# Altium schematic sheet LightSense.SchDoc
size A4; SheetNumber: 2; SheetTotal: 2
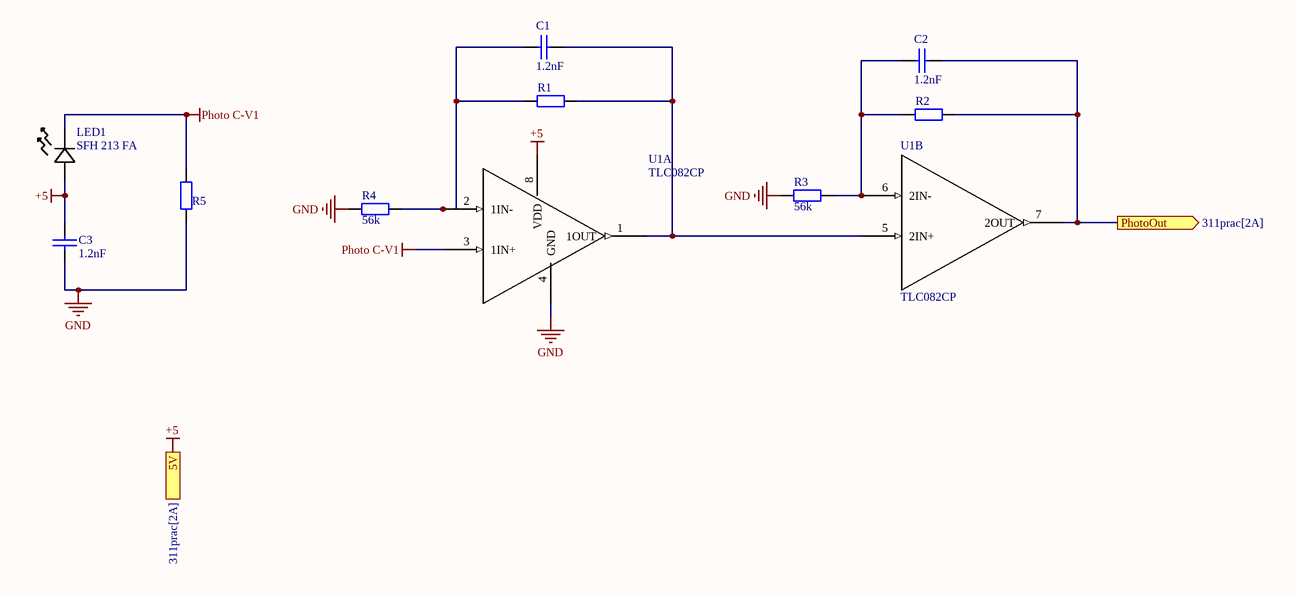
[diagram p0: LightSense.SchDoc]

## Parts
C1  value 1.2nF  [ECE-CAPR0.2x0.1TH]  (hidden comment: CAP000026)
C2  value 1.2nF  [ECE-CAPR0.2x0.1TH]  (hidden comment: CAP000026)
C3  value 1.2nF  [ECE-CAPR0.2x0.1TH]  (hidden comment: CAP000026)
LED1  SFH 213 FA  [LED_SFH 213 FA_OSR]
R1  RES000058  [ECE-RESA0.4TH]  (value not drawn)
R2  RES000058  [ECE-RESA0.4TH]  (value not drawn)
R3  value 56k  [ECE-RESA0.4TH]
R4  value 56k  [ECE-RESA0.4TH]  (hidden comment: RES000058)
R5  RES000058  [ECE-RESA0.4TH]  (value not drawn)
U1  TLC082CP  [TLC082_TH]  (parts A,B of 2)

## Ports
5V (in, see 311prac[2A]), PhotoOut (out, see 311prac[2A])

## Nets
+5: C3.2 LED1.2 U1.8(VDD) ; port 5V
GND: C3.1 R3.1 R4.1 R5.1 U1.4(GND)
Photo C-V1: LED1.1 R5.2 U1.3(1IN+)
PhotoOut: C2.2 R2.2 U1.7(2OUT) ; port PhotoOut
NetC1_1: C1.1 R1.1 R4.2 U1.2(1IN-)
NetC1_2: C1.2 R1.2 U1.1(1OUT) U1.5(2IN+)
NetC2_1: C2.1 R2.1 R3.2 U1.6(2IN-)

## Library data of the parts
C1-C3 = CMP-039-000025-1: CAP CER 1.2nF 50V TH; Path: ece/ts/Lists/Stock Inventory; Assembly Method: Through hole; Item Type: Item; Status: Obsolete; Component Type: NA; UoA Stock#: CAP000026; Datasheet Link: http://share.engineering.auckland.ac.nz/ece/ts/Student%20Documents/CER%20CAP.pdf; Size/Package: Radial; Voltage/Current: 50V; Category: Capacitor
LED1 = SFH 213 FA: Description; Manufacturer_Name: ams OSRAM; Copyright: Copyright (C) 2026 Ultra Librarian. All rights reserved.; Manufacturer_Part_Number: SFH 213 FA
R1 R2 R4 R5 = CMP-052-000057-1: RES MF 56K TH; Path: ece/ts/Lists/Stock Inventory; Voltage/Current: 0.6W; Item Type: Item; Assembly Method: Through hole; Component Type: NA; Size/Package: Axial 10mm; Supplier1: Active components; UoA Stock#: RES000058; Supplier1-PN: T442124; Category: Resistor; Status: Active
  R1 R2 R5: Value: 56k
R3 = CMP-052-000057-1: RES MF 56K TH; Path: ece/ts/Lists/Stock Inventory; Voltage/Current: 0.6W; Item Type: Item; Assembly Method: Through hole; UoA Stock#: RES000058; Component Type: NA; Size/Package: Axial 10mm; Supplier1: Active components; Supplier1-PN: T442124; Category: Resistor; Status: Active
U1 = TLC082CP: Dual, 16-V, 10-MHz, In to V- op amp 8-PDIP 0 to 70; Manufacturer_Name: Texas Instruments; Copyright: Copyright (C) 2026 Ultra Librarian. All rights reserved.; Manufacturer_Part_Number: TLC082CP; Datasheet: https://www.ti.com/lit/gpn/tlc082; RefDes: RefDes; Type: Type